# EasyEDA Pro project quardcopter-pcb.epro

# Schematic Schematic1
Board Name: Board1; Create Date: 2025-11-27; Page Name: P1; Project Name: 四轴; Schematic Name: Schematic1; Update Date: 2025-11-27; Company: 嘉立创EDA; Page Size: A4; Version: V1.0
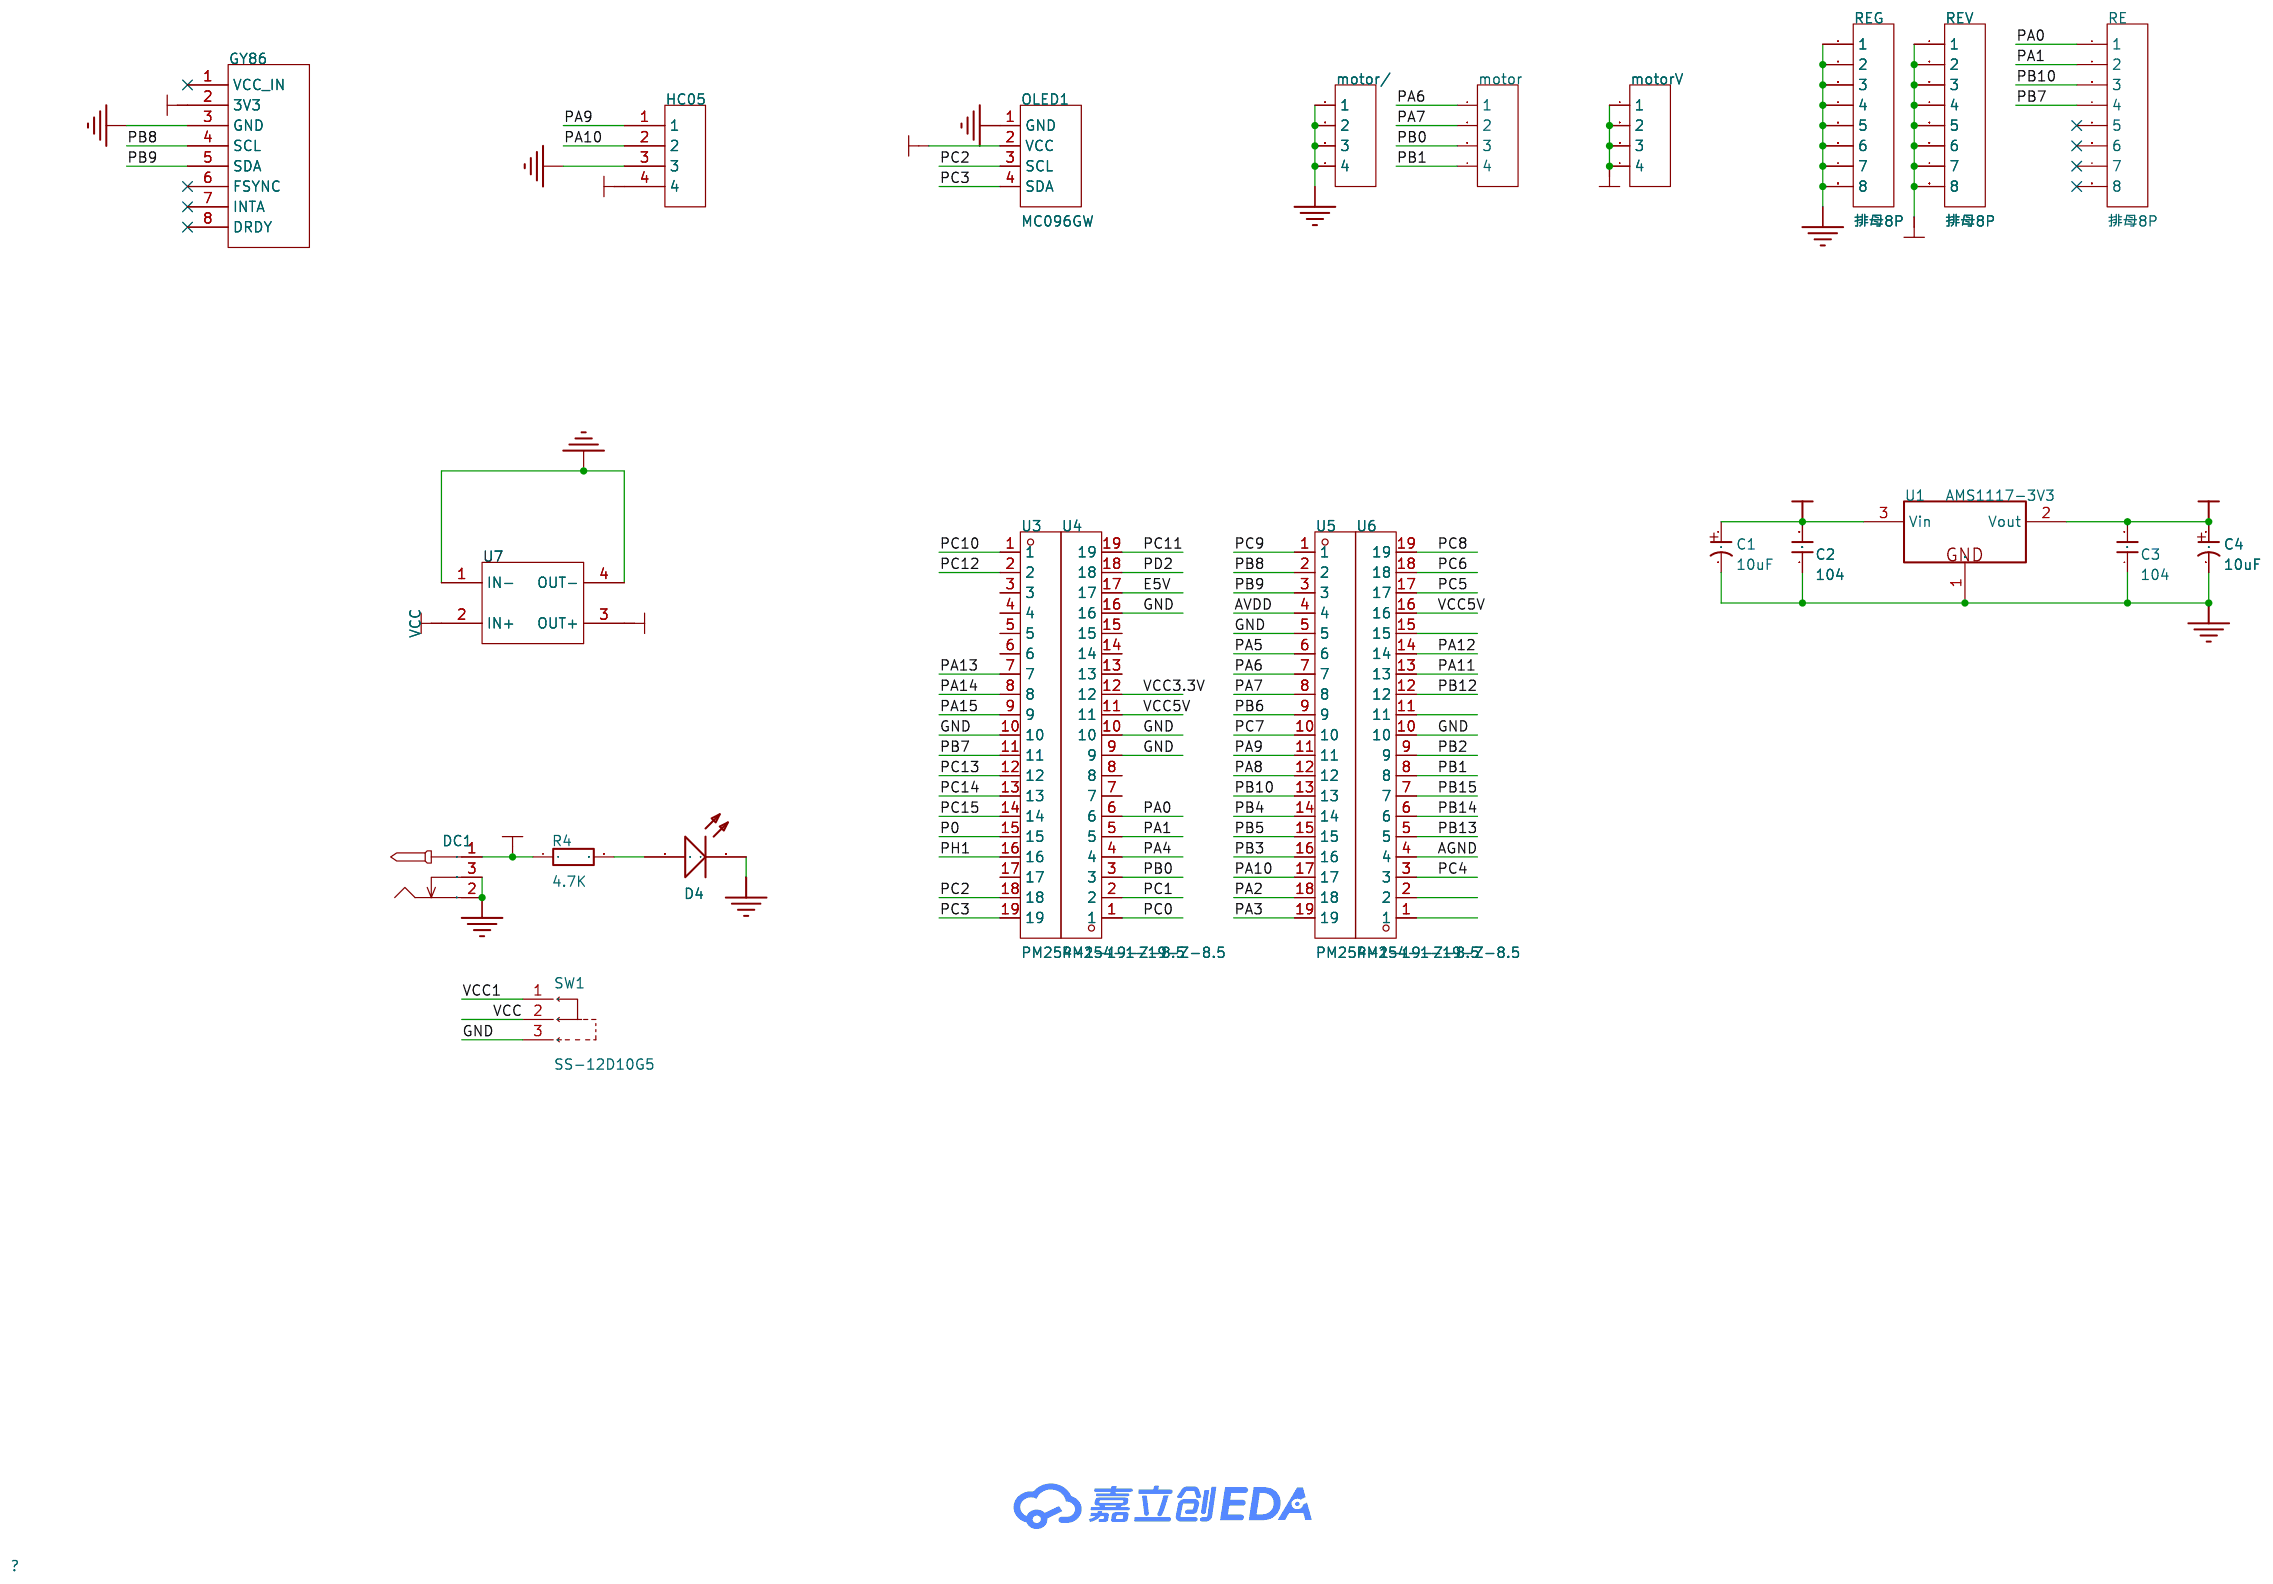
[diagram p0: schematic sheet]

## Parts
C1  10uF  [CAP 2.0*5*11]
C2  104  [C 0805_L]
C3  104  [C 0805_L]
C4  10uF  [CAP 2.0*5*11]
D4  LED  [LED 0805W]
DC1  -  [DC-005_2.5]
GY86  -  [GY86]
HC05  -  [HDR-TH_4P-P2.54-V-F]
motor  -  [排针/排母4p]
motor/  -  [排针/排母4p]
motorV  -  [排针/排母4p]
OLED1  MC096GW  [OLED-TH_4P-L27.8-W27.3_MC096GW]
R4  4.7K  [R 0805_L]
RE  排母8P  [HDR2.54-M-LI-8P]
REG  排母8P  [HDR2.54-M-LI-8P]
REV  排母8P  [HDR2.54-M-LI-8P]
SW1  SS-12D10G5  [SW-TH_3P-P4.8-L12.7-W6.7_SS12D10G3]
U1  AMS1117-3V3  [SOT223_N]
U3  PM254-1-19-Z-8.5  [HDR-TH_19P-P2.54-V-F]
U4  PM254-1-19-Z-8.5  [HDR-TH_19P-P2.54-V-F]
U5  PM254-1-19-Z-8.5  [HDR-TH_19P-P2.54-V-F]
U6  PM254-1-19-Z-8.5  [HDR-TH_19P-P2.54-V-F]
U7  -  [DC-DC]

## Library data of the parts
C1 C4 = 10uF: 直插电解电容; BOM名称: 直插电解电容; 学习资源: www.ooocke.com; 版权归属: 源创客; Design Item ID: C-CAP; Library Name: 电阻-电容-电感
C2 C3 = 104: 无极性贴片电容; BOM名称: 无极性贴片电容; 版权归属: 源创客; 学习资源: www.ooocke.com; 材质: X7R; Origin Footprint 1: C 0201_L; Origin Footprint 2: C 0402_L; Origin Footprint 3: C 0603_L; Origin Footprint 4: C 1206_L; Origin Footprint 5: C 1210_L; Origin Footprint 6: C 1808_L; Origin Footprint 7: C 1812_L; Origin Footprint 8: C 1825_L; Origin Footprint 9: C 2225_L; Origin Footprint 10: C 0201_M; Origin Footprint 11: C 0402_M; Origin Footprint 12: C 0603_M; Origin Footprint 13: C 0805_M; Origin Footprint 14: C 1206_M; Origin Footprint 15: C 1210_M; Origin Footprint 16: C 1808_M; Origin Footprint 17: C 1812_M; Origin Footprint 18: C 1825_M; Origin Footprint 19: C 2225_M; Design Item ID: C; Library Name: 电阻-电容-电感
D4 = LED: 发光二极管; 技术支持，联系售后: https://shop463601444.taobao.com; Library Name: 0.3 - LED发光二极管
DC1 = DC-005_2.5: Supplier Footprint: 插件
GY86 = GY86
HC05 = 排母4P
motor motor/ motorV = 排针4p
OLED1 = MC096GW: Supplier Part: C9900209498; Supplier Footprint: OLED-TH; Supplier: LCSC
R4 = 4.7K: 贴片电阻; BOM名称: 贴片电阻; 学习资源: www.ooocke.com; 版权归属: 源创客; Origin Footprint 1: R 0201_L; Origin Footprint 2: R 0402_L; Origin Footprint 3: R 0603_L; Origin Footprint 4: R 1206_L; Origin Footprint 5: R 1210_L; Origin Footprint 6: R 1812_L; Origin Footprint 7: R 2010_L; Origin Footprint 8: R 2512_L; Origin Footprint 9: R 0201_M; Origin Footprint 10: R 0402_M; Origin Footprint 11: R 0603_M; Origin Footprint 12: R 0805_M; Origin Footprint 13: R 1206_M; Origin Footprint 14: R 1210_M; Origin Footprint 15: R 1812_M; Origin Footprint 16: R 2010_M; Origin Footprint 17: R 2512_M; Design Item ID: 1R; Library Name: 电阻-电容-电感
RE REG REV = 排母8P: Origin Footprint 2: CN-JC2.54-8P; Origin Footprint 3: CN-PH2.0-8P; Origin Footprint 4: CN-PH2.0-8P-W; Origin Footprint 5: CN-VH3.96-8P; Origin Footprint 6: CN-XH2.54-8P; Origin Footprint 7: CN-XH2.54-8P-W; Origin Footprint 8: CN-XH2.54-8P-W-1; Origin Footprint 9: S-CN-JC2.0-8P; Origin Footprint 10: S-CN-JC2.54-8P; Origin Footprint 11: S-CN-PH2.0-8P; Origin Footprint 12: S-CN-PH2.0-8P-W; Origin Footprint 13: S-CN-XH2.54-8P; Origin Footprint 14: S-CN-VH3.96-8P; Origin Footprint 15: S-CN-XH2.54-8P-W; Origin Footprint 16: S-CN-XH2.54-8P-W-1
SW1 = SS-12D10G5_1: 操作正拨 插件立式 尺寸大型 大电流 两档位; Supplier Part: C22355762; Manufacturer: SOFNG(硕方); Supplier Footprint: SIP-3P,12.7x6.7mm; Datasheet: https://atta.szlcsc.com/upload/public/pdf/source/20241112/63BF7DBC64C442BC00A8F70551CADEFD.pdf; Supplier: LCSC
U1 = AMS1117-3V3: 三端稳压芯片; BOM名称: 稳压芯片; 版权归属: 源创客; 学习资源: www.ooocke.com; Origin Footprint 1: SOT223_L; Origin Footprint 2: SOT223_M; Origin Footprint 3: SOT89_L; Origin Footprint 4: SOT89_N; Origin Footprint 5: SOT89_M; Design Item ID: AMS1117; Library Name: 电源类芯片
U3-U6 = PM254-1-19-Z-8.5: 插孔结构:1x19P;间距:2.54mm;行距:-;圆孔/方孔:方孔;安装方式:直插;排数:单排;总孔位数:19P;额定电流:3A;额定电压:-;插孔方向:顶部;塑高:8.5mm;触头材质:铜合金;工作温度:-40℃~+105℃;; LCSC Part Name: 1x19P 间距:2.54mm 直插; Supplier Part: C2897382; Manufacturer: HCTL(华灿天禄); Supplier Footprint: 插件,P=2.54mm; JLCPCB Part Class: 扩展库; Datasheet: https://item.szlcsc.com/datasheet/PM254-1-19-Z-8.5/3142387.html; Supplier: LCSC; Holes Structure: 1x19P; Pitch: 2.54mm; Circular Hole / Square Hole: 方孔; Mounting Type: 直插; Number of Rows: 单排; Number of Positions: 19P; Current Rating: 3A; Holes Direction: 顶部; Insulation Height: 8.5mm; Contact Material: 铜合金; Operating Temperature: -40℃~+105℃
U7 = dc-dc降压模块: 3A可调降压模块DC-DC稳压电源 MP1584EN

## Nets
AGND: U6.4
AVDD: U5.4
GND: C1.2(K) C2.1 C3.1 C4.2(K) D4.2(K) DC1.2 DC1.3 GY86.3(GND) HC05.3 motor/.1 motor/.2 motor/.3 motor/.4 OLED1.1(GND) REG.1 REG.2 REG.3 REG.4 REG.5 REG.6 REG.7 REG.8 SW1.3 U1.1(GND) U3.10 U4.9 U4.10 U4.16 U5.5 U6.10 U7.1(IN-) U7.4(OUT-)
VCC: SW1.2 U7.2(IN+)
VCC1: DC1.1(4) R4.1 SW1.1
VCC3.3V: C3.2 C4.1(A) GY86.2(3V3) HC05.4 OLED1.2(VCC) U1.2(Vout) U4.12
VCC5V: C1.1(A) C2.2 motorV.1 motorV.2 motorV.3 motorV.4 REV.1 REV.2 REV.3 REV.4 REV.5 REV.6 REV.7 REV.8 U1.3(Vin) U4.11 U6.16 U7.3(OUT+)
E5V: U4.17
P0: U3.15
PA0: RE.1 U4.6
PA1: RE.2 U4.5
PA2: U5.18
PA3: U5.19
PA4: U4.4
PA5: U5.6
PA6: motor.1 U5.7
PA7: motor.2 U5.8
PA8: U5.12
PA9: HC05.1 U5.11
PA10: HC05.2 U5.17
PA11: U6.13
PA12: U6.14
PA13: U3.7
PA14: U3.8
PA15: U3.9
PB0: motor.3 U4.3
PB1: motor.4 U6.8
PB2: U6.9
PB3: U5.16
PB4: U5.14
PB5: U5.15
PB6: U5.9
PB7: RE.4 U3.11
PB8: GY86.4(SCL) U5.2
PB9: GY86.5(SDA) U5.3
PB10: RE.3 U5.13
PB12: U6.12
PB13: U6.5
PB14: U6.6
PB15: U6.7
PC0: U4.1
PC1: U4.2
PC2: OLED1.3(SCL) U3.18
PC3: OLED1.4(SDA) U3.19
PC4: U6.3
PC5: U6.17
PC6: U6.18
PC7: U5.10
PC8: U6.19
PC9: U5.1
PC10: U3.1
PC11: U4.19
PC12: U3.2
PC13: U3.12
PC14: U3.13
PC15: U3.14
PD2: U4.18
PH1: U3.16
$1N4634: D4.1(A) R4.2

Not connected (* = marked no-connect by the designer): GY86 1(VCC_IN)* 6(FSYNC)* 7(INTA)* 8(DRDY)*; RE 5* 6* 7* 8*; U3 3 4 5 6 17; U4 7 8 13 14 15; U6 1 2 11 15

# Board PCB1
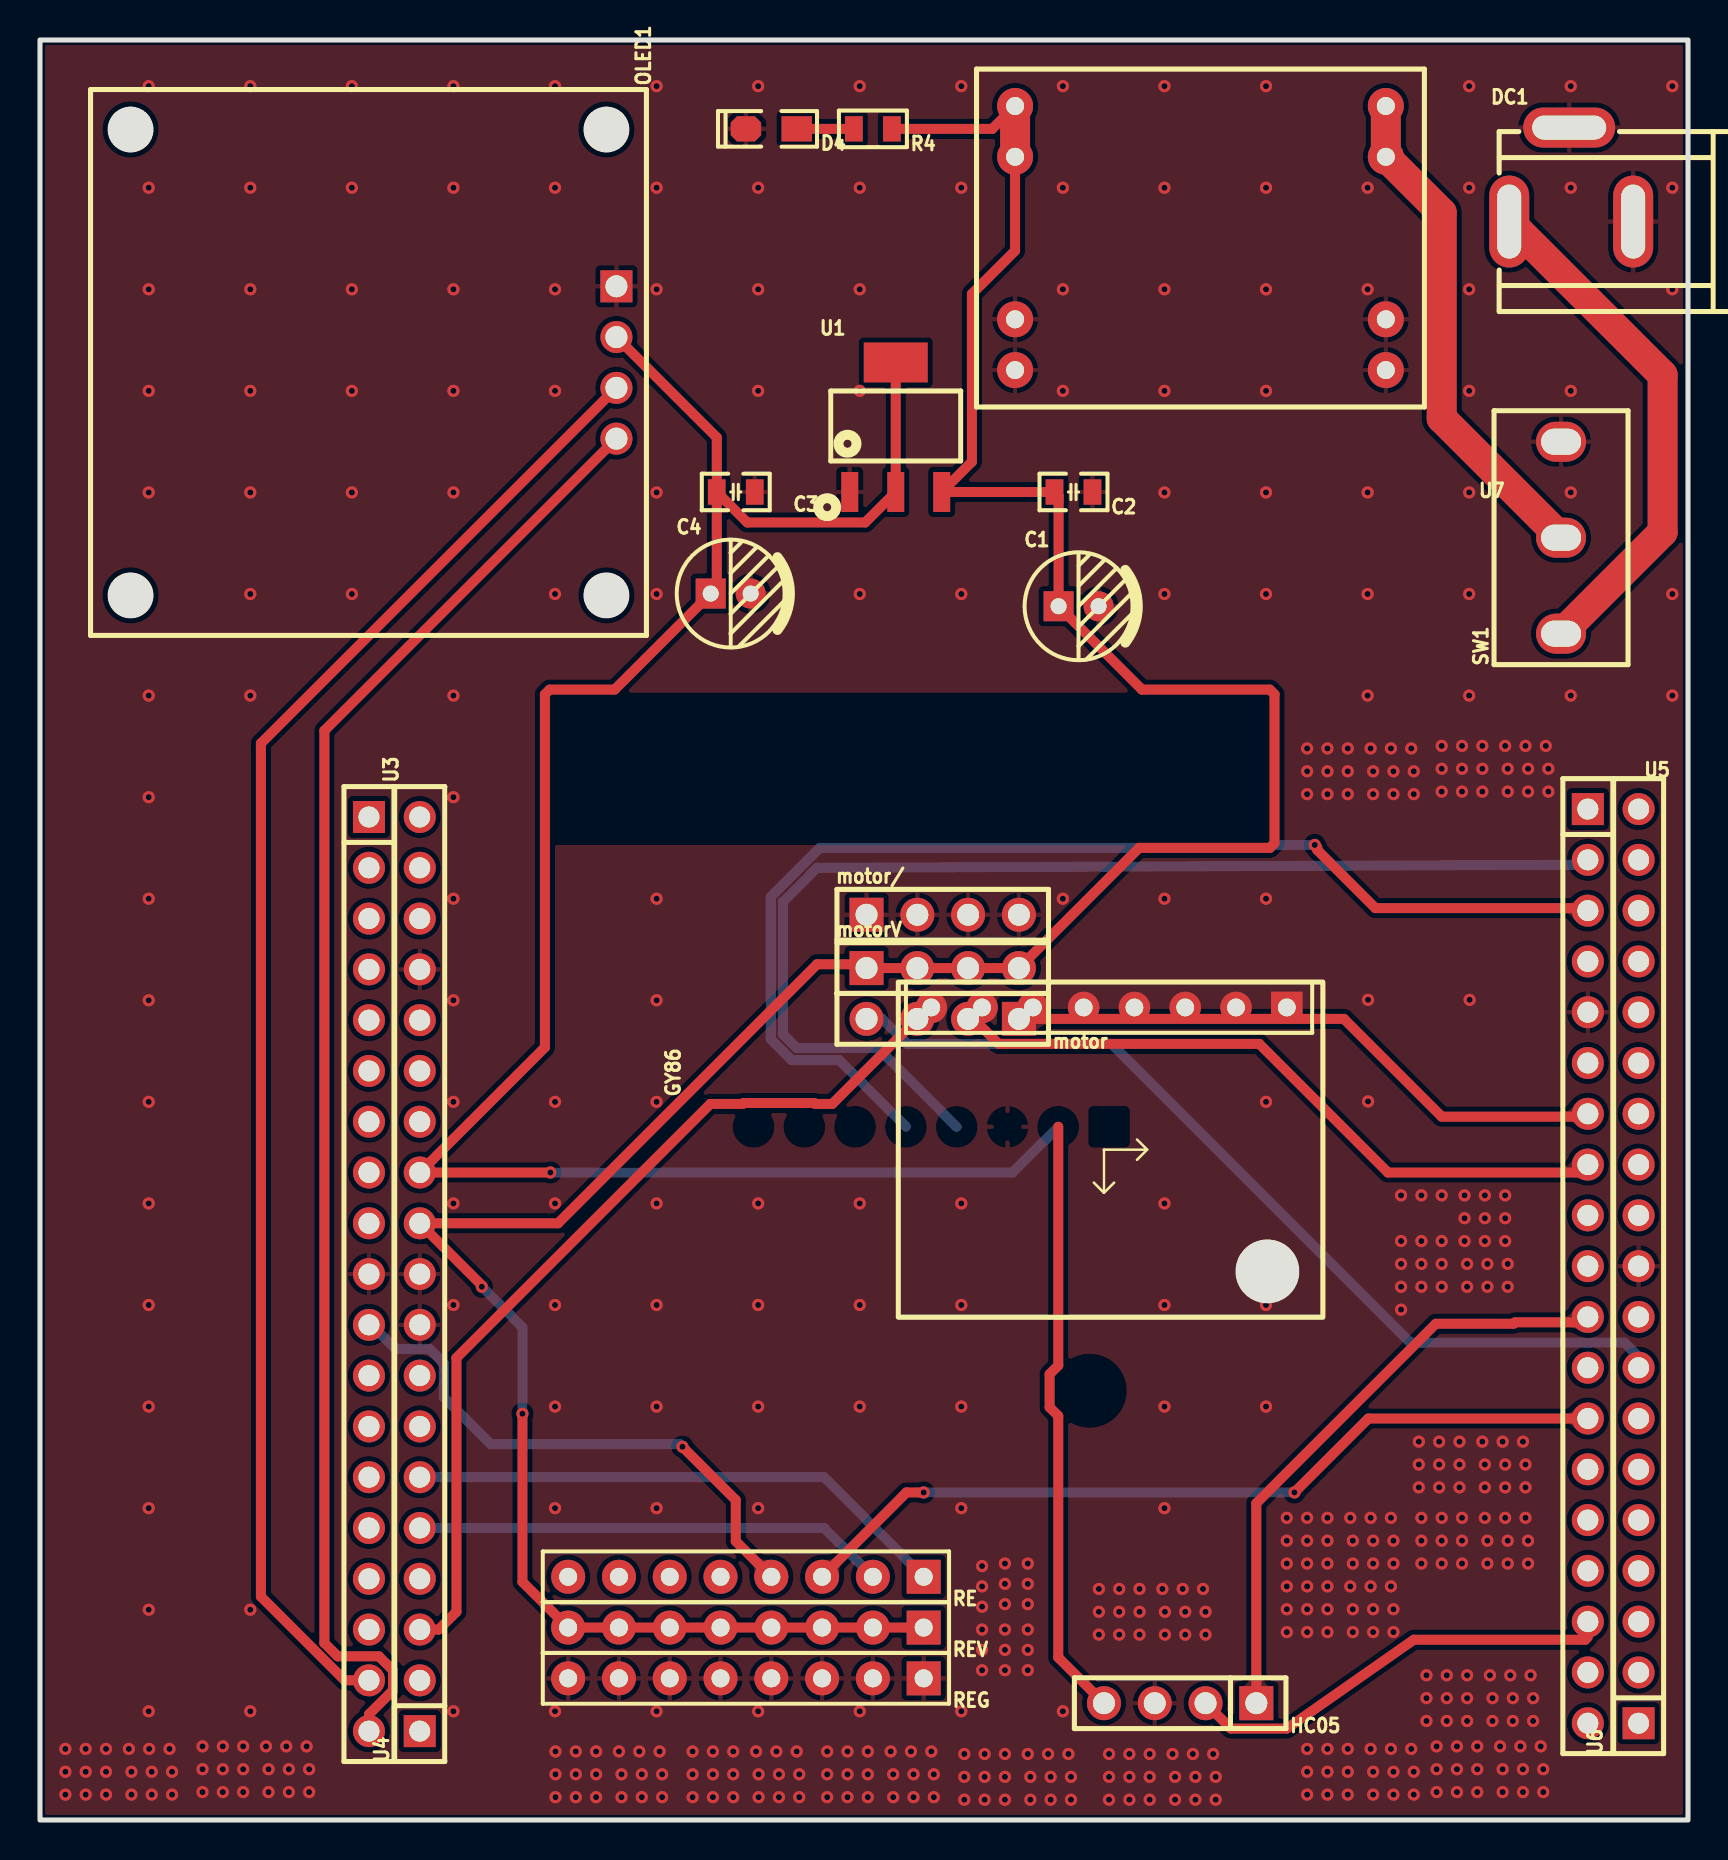
[diagram p1: board, top side]
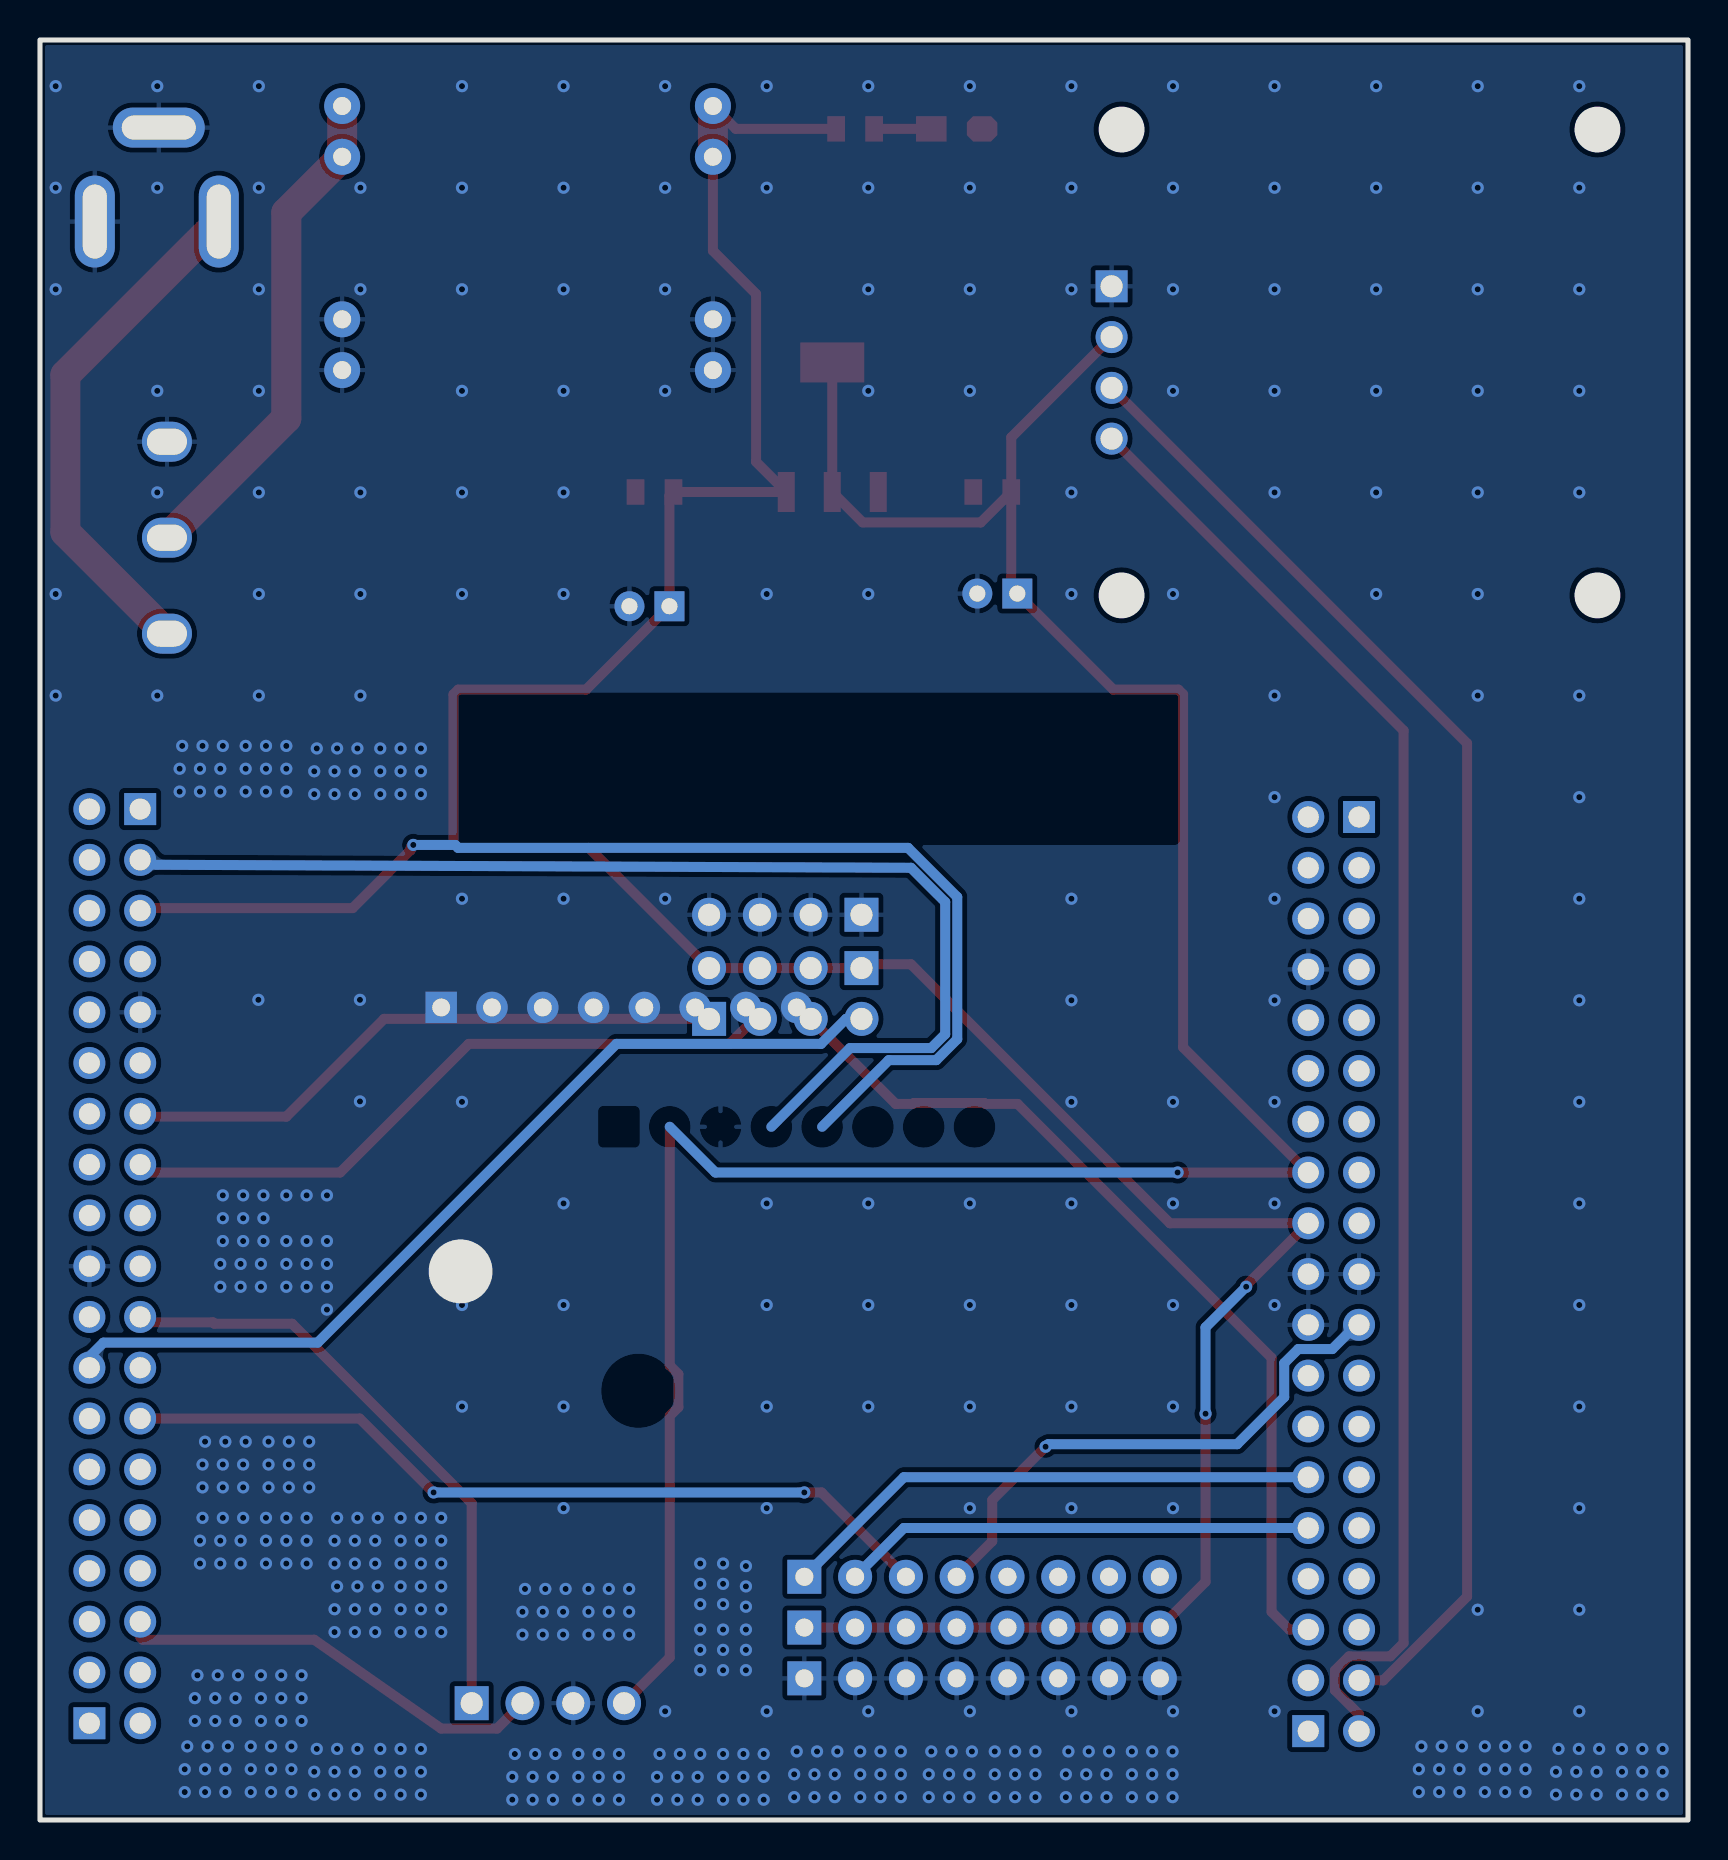
[diagram p2: board, bottom side, seen from below]

Outline 82.42 x 89.03 mm; copper layers: Top Layer, Bottom Layer. Coordinates in mm from the lower left corner of the outline.
Outline path: rectangle 0,89.03 82.42,0
Stack: Top Layer 0.035mm / Dielectric1 1.51mm FR4 er 4.5 / Bottom Layer 0.035mm

## Design rules (mm)
template: JLCPCB Capability(Two Layers Board)
spacing copperThickness1oz (default): track to track 0.102, other pairs 0.152 to 0.3
spacing copperThickness2oz: track to track 0.203, other pairs 0.152 to 0.3
track width copperThickness1oz (default): min 0.127, default 0.254, max 2.54
track width copperThickness2oz: min 0.203, default 0.254, max 2.54
differential pair differentialPair (default): width min 0.127, default 0.254, max 2.54; gap min 0.152, default 0.152
via viaSize (default): diameter min 0.5, default 0.61, max 10; hole min 0.3, default 0.305, max 6.3

## Placement (name value [footprint] x y rotation side)
C1  10uF  [CAP 2.0*5*11]  51.94 60.71 0 top
C2  104  [C 0805_L]  51.69 66.42 180 top
C3  104  [C 0805_L]  34.8 66.42 180 top
C4  10uF  [CAP 2.0*5*11]  34.54 61.34 0 top
D4  LED  [LED 0805W]  36.58 84.58 180 top
DC1  -  [DC-005_2.5]  76.71 80.26 0 top
GY86  -  [GY86]  53.47 34.67 270 top
HC05  -  [HDR-TH_4P-P2.54-V-F]  57.02 5.84 180 top
motor  -  [排针/排母4p]  45.15 40.07 180 top
motor/  -  [排针/排母4p]  45.15 45.28 0 top
motorV  -  [排针/排母4p]  45.15 42.61 0 top
OLED1  MC096GW  [OLED-TH_4P-L27.8-W27.3_MC096GW]  28.83 72.9 270 top
R4  4.7K  [R 0805_L]  41.66 84.58 180 top
RE  排母8P  [HDR2.54-M-LI-8P]  35.31 12.17 180 top
REG  排母8P  [HDR2.54-M-LI-8P]  35.31 7.09 180 top
REV  排母8P  [HDR2.54-M-LI-8P]  35.31 9.62 180 top
SW1  SS-12D10G5  [SW-TH_3P-P4.8-L12.7-W6.7_SS12D10G3]  76.07 64.14 90 top
U1  AMS1117-3V3  [SOT223_N]  42.8 69.72 0 top
U3  PM254-1-19-Z-8.5  [HDR-TH_19P-P2.54-V-F]  16.45 27.31 270 top
U4  PM254-1-19-Z-8.5  [HDR-TH_19P-P2.54-V-F]  18.99 27.31 90 top
U5  PM254-1-19-Z-8.5  [HDR-TH_19P-P2.54-V-F]  77.41 27.7 270 top
U6  PM254-1-19-Z-8.5  [HDR-TH_19P-P2.54-V-F]  79.95 27.7 90 top
U7  -  [DC-DC]  58.8 78.61 180 top

## Footprints (pads in the part's own frame, mm; a bottom-side part is the same pattern mirrored in y, then rotated)
C 0805_L
  rect 0.889x1.27 smd: 1(-0.95,0) 2(0.95,0)
CAP 2.0*5*11
  rect 1.5x1.5 hole 0.8: 1(-1,0)
  round 1.5 hole 0.8: 2(1,0)
DC-005_2.5
  oval 2x4.6 hole 1.2x3.7: 1(-3.227,-0.318) 2(2.973,-0.318)
  oval 4.6x2 hole 3.7x1.2: 3(-0.227,4.382)
DC-DC
  round 1.8 hole 0.9: 1(-8.509,6.096) 1(-8.509,3.556) 2(-8.509,-4.572) 2(-8.509,-7.112) 3(10.033,-4.572) 3(10.033,-7.112) 4(10.033,3.556)
  oval 1.8x1.8 hole 0.9: 4(10.033,6.096)
GY86
  rect 1.575x1.575 hole 0.889: 1(-5.969,8.89)
  round 1.575 hole 0.889: 2(-5.969,6.35) 3(-5.969,3.81) 4(-5.969,1.27) 5(-5.969,-1.27) 6(-5.969,-3.81) 7(-5.969,-6.35) 8(-5.969,-8.89)
HDR2.54-M-LI-8P
  rect 1.7x1.7 hole 0.9: 1(-8.89,0)
  round 1.7 hole 0.9: 2(-6.35,0) 3(-3.81,0) 4(-1.27,0) 5(1.27,0) 6(3.81,0) 7(6.35,0) 8(8.89,0)
HDR-TH_4P-P2.54-V-F
  rect 1.7x1.7 hole 1.1: 1(-3.81,0)
  round 1.7 hole 1.1: 2(-1.27,0) 3(1.27,0) 4(3.81,0)
HDR-TH_19P-P2.54-V-F
  rect 1.6x1.6 hole 1.05: 1(-22.86,0)
  round 1.6 hole 1.05: 2(-20.32,0) 3(-17.78,0) 4(-15.24,0) 5(-12.7,0) 6(-10.16,0) 7(-7.62,0) 8(-5.08,0) 9(-2.54,0) 10(0,0) 11(2.54,0) 12(5.08,0) 13(7.62,0) 14(10.16,0) 15(12.7,0) 16(15.24,0) 17(17.78,0) 18(20.32,0) 19(22.86,0)
LED 0805W
  rect 1.524x1.27 smd: 1(-1.27,0)
  custom 1.524x1.27 smd: 2(1.27,0)
OLED-TH_4P-L27.8-W27.3_MC096GW
  rect 1.6x1.6 hole 1.1: 1(-3.81,0)
  round 1.6 hole 1.1: 2(-1.27,0) 3(1.27,0) 4(3.81,0)
R 0805_L
  rect 0.889x1.27 smd: 1(-0.95,0) 2(0.95,0)
SOT223_N
  rect 0.85x2 smd: 1(-2.3,-3.302) 2(0,-3.302) 3(2.3,-3.302)
  rect 3.2x2 smd: 2(0,3.175)
SW-TH_3P-P4.8-L12.7-W6.7_SS12D10G3
  oval 2x2.5 hole 1.3x2: 1(-4.8,0) 2(0,0) 3(4.8,0)
排针/排母4p
  rect 1.7x1.7 hole 1.1: 1(-3.81,0)
  round 1.7 hole 1.1: 2(-1.27,0) 3(1.27,0) 4(3.81,0)

## Nets
As in the schematic, except:
VCC1: DC1.1 SW1.1
VCC5V: C1.1 C2.2 motorV.1 motorV.2 motorV.3 motorV.4 R4.1 REV.1 REV.2 REV.3 REV.4 REV.5 REV.6 REV.7 REV.8 U1.3 U4.11 U7.3

Pads without a net: GY86 1 6 7 8; RE 5 6 7 8; U3 3 4 5 6 17; U4 7 8 13 14 15; U6 16

## Via types
v1: diameter 0.61, hole 0.305, Top Layer to Bottom Layer, 505 vias

## Routing (per net, layer and track width the routed paths; a pad name or vN(x,y) marks a point on that pad's centre or on a via; arc(x,y) is an arc through that point)
GND:
  vias: v1(1.27,3.56) v1(1.27,2.41) v1(1.27,1.27) v1(2.29,3.56) v1(2.29,2.41) v1(2.29,1.27) v1(3.3,3.56) v1(3.3,2.41) v1(3.3,1.27) v1(4.45,3.56) v1(4.57,2.41) v1(4.57,1.27) v1(5.44,86.72) v1(5.44,81.64) v1(5.44,76.56) v1(5.44,71.48) v1(5.44,66.4) v1(5.44,56.24) v1(5.44,51.16) v1(5.44,46.08) v1(5.44,41) v1(5.44,35.92) v1(5.44,30.84) v1(5.44,25.76) v1(5.44,20.68) v1(5.44,15.6) v1(5.44,10.52) v1(5.44,5.44) v1(5.46,3.56) v1(5.59,2.41) v1(5.59,1.27) v1(6.48,3.56) v1(6.6,2.41) v1(6.6,1.27) v1(8.13,3.68) v1(8.13,2.54) v1(8.13,1.4) v1(9.14,3.68) v1(9.14,2.54) v1(9.14,1.4) v1(10.16,3.68) v1(10.16,2.54) v1(10.16,1.4) v1(10.52,86.72) v1(10.52,81.64) v1(10.52,76.56) v1(10.52,71.48) v1(10.52,66.4) v1(10.52,61.32) v1(10.52,56.24) v1(10.52,10.52) v1(10.52,5.44) v1(11.3,3.68) v1(11.43,2.54) v1(11.43,1.4) v1(12.32,3.68) v1(12.45,2.54) v1(12.45,1.4) v1(13.34,3.68) v1(13.46,2.54) v1(13.46,1.4) v1(15.6,86.72) v1(15.6,81.64) v1(15.6,76.56) v1(15.6,71.48) v1(15.6,66.4) v1(15.6,61.32) v1(20.68,86.72) v1(20.68,81.64) v1(20.68,76.56) v1(20.68,71.48) v1(20.68,66.4) v1(20.68,56.24) v1(20.68,51.16) v1(20.68,46.08) v1(20.68,41) v1(20.68,35.92) v1(20.68,30.84) v1(20.68,25.76) v1(20.68,5.44) v1(25.76,86.72) v1(25.76,81.64) v1(25.76,76.56) v1(25.76,71.48) v1(25.76,61.32) v1(25.76,35.92) v1(25.76,30.84) v1(25.76,25.76) v1(25.76,20.68) v1(25.76,15.6) v1(25.76,5.44) v1(25.78,3.43) v1(25.78,2.29) v1(25.78,1.14) v1(26.8,3.43) v1(26.8,2.29) v1(26.8,1.14) v1(27.81,3.43) v1(27.81,2.29) v1(27.81,1.14) v1(28.96,3.43) v1(29.08,2.29) v1(29.08,1.14) v1(29.97,3.43) v1(30.1,2.29) v1(30.1,1.14) v1(30.84,86.72) v1(30.84,81.64) v1(30.84,76.56) v1(30.84,66.4) v1(30.84,61.32) v1(30.84,46.08) v1(30.84,41) v1(30.84,35.92) v1(30.84,30.84) v1(30.84,25.76) v1(30.84,20.68) v1(30.84,15.6) v1(30.84,5.44) v1(30.99,3.43) v1(31.12,2.29) v1(31.12,1.14) v1(32.64,3.43) v1(32.64,2.29) v1(32.64,1.14) v1(33.66,3.43) v1(33.66,2.29) v1(33.66,1.14) v1(34.67,3.43) v1(34.67,2.29) v1(34.67,1.14) v1(35.81,3.43) v1(35.92,86.72) v1(35.92,81.64) v1(35.92,76.56) v1(35.92,71.48) v1(35.92,30.84) v1(35.92,25.76) v1(35.92,20.68) v1(35.92,15.6) v1(35.92,5.44) v1(35.94,2.29) v1(35.94,1.14) v1(36.83,3.43) v1(36.96,2.29) v1(36.96,1.14) v1(37.85,3.43) v1(37.97,2.29) v1(37.97,1.14) v1(39.37,3.43) v1(39.37,2.29) v1(39.37,1.14) v1(40.39,3.43) v1(40.39,2.29) v1(40.39,1.14) v1(41,86.72) v1(41,81.64) v1(41,76.56) v1(41,71.48) v1(41,61.32) v1(41,30.84) v1(41,25.76) v1(41,20.68) v1(41,5.44) v1(41.4,3.43) v1(41.4,2.29) v1(41.4,1.14) v1(42.55,3.43) v1(42.67,2.29) v1(42.67,1.14) v1(43.56,3.43) v1(43.69,2.29) v1(43.69,1.14) v1(44.58,3.43) v1(44.7,2.29) v1(44.7,1.14) v1(46.08,86.72) v1(46.08,81.64) v1(46.08,61.32) v1(46.08,30.84) v1(46.08,25.76) v1(46.08,20.68) v1(46.08,15.6) v1(46.08,5.44) v1(46.23,3.3) v1(46.23,2.16) v1(46.23,1.02) v1(47.12,12.7) v1(47.12,11.68) v1(47.12,10.67) v1(47.12,9.53) v1(47.12,8.51) v1(47.12,7.49) v1(47.24,3.3) v1(47.24,2.16) v1(47.24,1.02) v1(48.26,12.83) v1(48.26,11.81) v1(48.26,10.8) v1(48.26,9.53) v1(48.26,8.51) v1(48.26,7.49) v1(48.26,3.3) v1(48.26,2.16) v1(48.26,1.02) v1(49.4,12.83) v1(49.4,11.81) v1(49.4,10.8) v1(49.4,9.53) v1(49.4,8.51) v1(49.4,7.49) v1(49.4,3.3) v1(49.53,2.16) v1(49.53,1.02) v1(50.42,3.3) v1(50.55,2.16) v1(50.55,1.02) v1(51.16,86.72) v1(51.16,81.64) v1(51.16,76.56) v1(51.16,71.48) v1(51.16,46.08) v1(51.16,5.44) v1(51.44,3.3) v1(51.56,2.16) v1(51.56,1.02) v1(52.96,11.56) v1(52.96,10.41) v1(52.96,9.27) v1(53.47,3.3) v1(53.47,2.16) v1(53.47,1.02) v1(53.97,11.56) v1(53.97,10.41) v1(53.97,9.27) v1(54.48,3.3) v1(54.48,2.16) v1(54.48,1.02) v1(54.99,11.56) v1(54.99,10.41) v1(54.99,9.27) v1(55.5,3.3) v1(55.5,2.16) v1(55.5,1.02) v1(56.13,11.56) v1(56.24,86.72) v1(56.24,81.64) v1(56.24,76.56) v1(56.24,71.48) v1(56.24,66.4) v1(56.24,61.32) v1(56.24,46.08) v1(56.24,30.84) v1(56.24,25.76) v1(56.24,20.68) v1(56.24,15.6) v1(56.26,10.41) v1(56.26,9.27) v1(56.64,3.3) v1(56.77,2.16) v1(56.77,1.02) v1(57.15,11.56) v1(57.28,10.41) v1(57.28,9.27) v1(57.66,3.3) v1(57.78,2.16) v1(57.78,1.02) v1(58.17,11.56) v1(58.29,10.41) v1(58.29,9.27) v1(58.67,3.3) v1(58.8,2.16) v1(58.8,1.02) v1(61.32,86.72) v1(61.32,81.64) v1(61.32,76.56) v1(61.32,71.48) v1(61.32,66.4) v1(61.32,61.32) v1(61.32,46.08) v1(61.32,35.92) v1(61.32,25.76) v1(61.32,20.68) v1(62.36,15.11) v1(62.36,13.97) v1(62.36,12.83) v1(62.36,11.68) v1(62.36,10.54) v1(62.36,9.4) v1(63.37,53.59) v1(63.37,52.45) v1(63.37,51.31) v1(63.37,15.11) v1(63.37,13.97) v1(63.37,12.83) v1(63.37,11.68) v1(63.37,10.54) v1(63.37,9.4) v1(63.37,3.56) v1(63.37,2.41) v1(63.37,1.27) v1(64.39,53.59) v1(64.39,52.45) v1(64.39,51.31) v1(64.39,15.11) v1(64.39,13.97) v1(64.39,12.83) v1(64.39,11.68) v1(64.39,10.54) v1(64.39,9.4) v1(64.39,3.56) v1(64.39,2.41) v1(64.39,1.27) v1(65.41,53.59) v1(65.41,52.45) v1(65.41,51.31) v1(65.41,3.56) v1(65.41,2.41) v1(65.41,1.27) v1(65.53,15.11) v1(65.53,11.68) v1(65.66,13.97) v1(65.66,12.83) v1(65.66,10.54) v1(65.66,9.4) v1(66.4,81.64) v1(66.4,76.56) v1(66.4,66.4) v1(66.4,61.32) v1(66.4,56.24) v1(66.42,41.02) v1(66.42,35.94) v1(66.55,53.59) v1(66.55,15.11) v1(66.55,11.68) v1(66.55,3.56) v1(66.68,52.45) v1(66.68,51.31) v1(66.68,13.97) v1(66.68,12.83) v1(66.68,10.54) v1(66.68,9.4) v1(66.68,2.41) v1(66.68,1.27) v1(67.56,53.59) v1(67.56,15.11) v1(67.56,11.68) v1(67.56,3.56) v1(67.69,52.45) v1(67.69,51.31) v1(67.69,13.97) v1(67.69,12.83) v1(67.69,10.54) v1(67.69,9.4) v1(67.69,2.41) v1(67.69,1.27) v1(68.07,31.24) v1(68.07,28.96) v1(68.07,27.81) v1(68.07,26.67) v1(68.07,25.53) v1(68.58,53.59) v1(68.58,3.56) v1(68.71,52.45) v1(68.71,51.31) v1(68.71,2.41) v1(68.71,1.27) v1(68.96,18.92) v1(68.96,17.78) v1(68.96,16.64) v1(69.09,31.24) v1(69.09,28.96) v1(69.09,27.81) v1(69.09,26.67) v1(69.09,15.11) v1(69.09,13.97) v1(69.09,12.83) v1(69.34,7.24) v1(69.34,6.1) v1(69.34,4.95) v1(69.85,3.68) v1(69.85,2.54) v1(69.85,1.4) v1(69.98,18.92) v1(69.98,17.78) v1(69.98,16.64) v1(70.1,53.72) v1(70.1,52.58) v1(70.1,51.44) v1(70.1,31.24) v1(70.1,28.96) v1(70.1,27.81) v1(70.1,26.67) v1(70.1,15.11) v1(70.1,13.97) v1(70.1,12.83) v1(70.36,7.24) v1(70.36,6.1) v1(70.36,4.95) v1(70.87,3.68) v1(70.87,2.54) v1(70.87,1.4) v1(70.99,18.92) v1(70.99,17.78) v1(70.99,16.64) v1(71.12,53.72) v1(71.12,52.58) v1(71.12,51.44) v1(71.12,15.11) v1(71.12,13.97) v1(71.12,12.83) v1(71.25,31.24) v1(71.25,30.1) v1(71.25,28.96) v1(71.37,27.81) v1(71.37,26.67) v1(71.37,7.24) v1(71.37,6.1) v1(71.37,4.95) v1(71.48,86.72) v1(71.48,81.64) v1(71.48,76.56) v1(71.48,71.48) v1(71.48,66.4) v1(71.48,61.32) v1(71.48,56.24) v1(71.5,41.02) v1(71.88,3.68) v1(71.88,2.54) v1(71.88,1.4) v1(72.14,53.72) v1(72.14,52.58) v1(72.14,51.44) v1(72.14,18.92) v1(72.26,31.24) v1(72.26,30.1) v1(72.26,28.96) v1(72.26,17.78) v1(72.26,16.64) v1(72.26,15.11) v1(72.39,27.81) v1(72.39,26.67) v1(72.39,13.97) v1(72.39,12.83) v1(72.52,7.24) v1(72.64,6.1) v1(72.64,4.95) v1(73.03,3.68) v1(73.15,18.92) v1(73.15,2.54) v1(73.15,1.4) v1(73.28,53.72) v1(73.28,31.24) v1(73.28,30.1) v1(73.28,28.96) v1(73.28,17.78) v1(73.28,16.64) v1(73.28,15.11) v1(73.41,52.58) v1(73.41,51.44) v1(73.41,27.81) v1(73.41,26.67) v1(73.41,13.97) v1(73.41,12.83) v1(73.53,7.24) v1(73.66,6.1) v1(73.66,4.95) v1(74.04,3.68) v1(74.17,18.92) v1(74.17,2.54) v1(74.17,1.4) v1(74.3,53.72) v1(74.3,17.78) v1(74.3,16.64) v1(74.3,15.11) v1(74.42,52.58) v1(74.42,51.44) v1(74.42,13.97) v1(74.42,12.83) v1(74.55,7.24) v1(74.68,6.1) v1(74.68,4.95) v1(75.06,3.68) v1(75.18,2.54) v1(75.18,1.4) v1(75.31,53.72) v1(75.44,52.58) v1(75.44,51.44) v1(76.56,86.72) v1(76.56,81.64) v1(76.56,71.48) v1(76.56,66.4) v1(76.56,56.24) v1(81.64,86.72) v1(81.64,81.64) v1(81.64,76.56) v1(81.64,61.32) v1(81.64,56.24)
VCC: length 25.2
  Top Layer w1.5: U7.2 U7.2 70.1,80.39 70.1,70.1 SW1.2
VCC1: length 25.9
  Top Layer w1.5: SW1.1 81.15,64.42 81.15,72.27 DC1.1
VCC3.3V: length 131.6
  Top Layer w0.5: C3.2 33.85,69.15 OLED1.2 ; C3.2 35.37,64.9 41.28,64.9 U1.2 U1.2 ; C3.2 33.85,61.65 C4.1 28.74,56.54 25.49,56.54 25.25,56.3 25.25,38.64 U4.12 v1(25.53,32.39) ; 50.93,34.67 50.93,22.73 50.5,22.3 50.5,20.64 50.93,20.21 50.93,8.13 HC05.4
  Bottom Layer w0.5: v1(25.53,32.39) 48.64,32.39 50.93,34.67
VCC5V: length 150.8
  Top Layer w0.5: v1(22.1,26.67) 22.1,26.74 U4.11 25.91,29.85 38.86,42.8 41.15,42.8 motorV.1 motorV.2 motorV.3 motorV.4 54.97,48.62 61.51,48.62 61.74,48.86 61.74,56.3 61.51,56.54 55.11,56.54 C1.1 50.94,66.22 C2.2 U1.3 46.61,67.93 46.61,76.33 48.77,78.49 U7.3 ; U7.3 47.62,84.58 R4.1 ; v1(24.13,20.32) 24.13,11.91 REV.8 REV.7 REV.6 REV.5 REV.4 REV.3 REV.2 REV.1
  Top Layer w1.5: U7.3 U7.3
  Bottom Layer w0.5: v1(24.13,20.32) 24.13,24.64 v1(22.1,26.67)
PA0: length 27.3
  Bottom Layer w0.5: U4.6 39.22,17.15 RE.1
PA1: length 23.7
  Bottom Layer w0.5: U4.5 39.22,14.61 RE.2
PA6: length 30.5
  Top Layer w0.5: U5.7 77.27,35.18 70.1,35.18 65.21,40.07 motor.1
PA7: length 34.3
  Top Layer w0.5: U5.8 77.02,32.39 67.41,32.39 60.98,38.82 47.94,38.82 46.69,40.07 motor.2
PA9: length 30.4
  Top Layer w0.5: HC05.1 60.83,15.84 69.81,24.82 73.7,24.82 73.77,24.89 76.89,24.89 77.16,25.16 U5.11
PA10: length 21.1
  Top Layer w0.5: HC05.2 59.56,4.57 62.36,4.57 68.71,9.02 77.29,9.02 77.41,9.14
PB0: length 45
  Top Layer w0.5: motor.3 39.62,35.81 38.77,35.81 38.72,35.86 35.19,35.86 35.15,35.81 33.53,35.81 20.83,23.11 20.83,10.41 19.94,9.53 U4.3
PB1: length 46.2
  Bottom Layer w0.5: motor.4 42.11,40.07 43.36,38.82 53.59,38.82 68.53,23.88 79.25,23.88 79.95,23.17 U6.8
PB7: length 27.5
  Top Layer w0.5: RE.4 34.8,13.94 34.8,16 v1(32.13,18.67)
  Bottom Layer w0.5: v1(32.13,18.67) 32,18.8 22.55,18.8 20.19,21.15 20.19,22.85 19.49,23.55 17.79,23.55 16.58,24.77 U3.11
PB8: length 58.2
  Bottom Layer w0.5: 45.85,34.67 41.91,38.61 37.85,38.61 37.15,39.3 37.15,45.91 38.86,47.63 77.41,47.78
PB9: length 59.1
  Top Layer w0.5: v1(63.75,48.77) 63.88,48.64 63.88,48.51 66.79,45.61 77.29,45.61 U5.3
  Bottom Layer w0.5: v1(63.75,48.77) 61.66,48.77 61.51,48.62 39.01,48.62 36.55,46.16 36.55,39.05 37.6,38.01 39.97,38.01 43.31,34.67
PB10: length 41.6
  Top Layer w0.5: RE.3 43.33,16.38 v1(44.2,16.38) ; U5.13 66.44,20.08 v1(62.74,16.38)
  Bottom Layer w0.5: v1(62.74,16.38) v1(44.2,16.38)
PC2: length 75
  Top Layer w0.5: OLED1.3 11.05,53.85 11.05,11.18 15.24,6.99 U3.18
PC3: length 73.8
  Top Layer w0.5: U3.19 16.45,5.28 17.66,6.49 17.66,7.48 16.95,8.19 14.89,8.19 14.22,8.85 14.22,54.48 OLED1.4
$1N4634: length 2.9
  Top Layer w0.5: R4.2 D4.1

## Copper pours and planes (outline as drawn; the poured copper is in the pictures)
GND on Top Layer: -7.24,96.52 95.25,96.52 95.25,-15.11 -7.24,-15.11
GND on Top Layer: -2.92,91.57 88.52,91.57 88.52,-3.81 -2.92,-3.81
GND on Bottom Layer: -13.21,98.93 103.63,98.93 103.63,-17.14 -13.21,-17.14
GND on Bottom Layer: -5.21,93.98 87.63,93.98 87.63,-5.21 -5.21,-5.21

Small or netless copper shapes (teardrops, artwork), in the pictures only: 12 on Top Layer, 6 on Bottom Layer
